# Altium project Anten_Tracker_Karti.PrjPcb
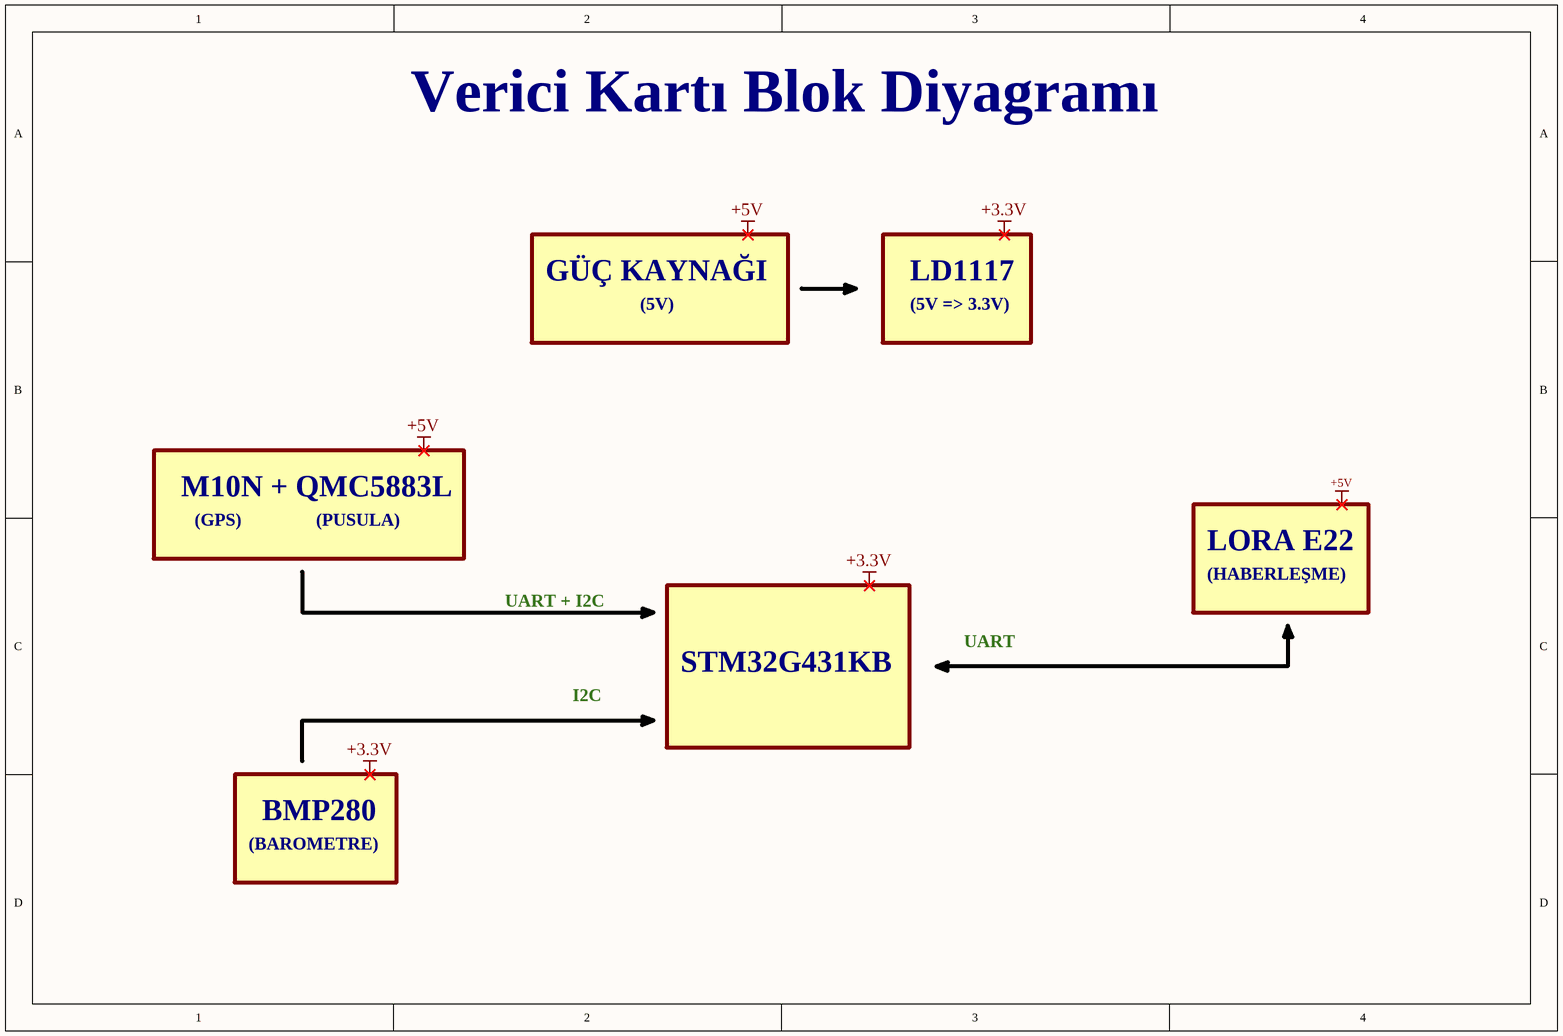
[diagram p0: Verici_Karti_Blok_Diyagram.SchDoc]
6 sheets, 105 parts. Net scope: global (net labels, ports and power ports of the same name join across sheets).
Board file: Anten-Tracker-PCB.PcbDoc
Sheets:
  Verici_Karti_Blok_Diyagram.SchDoc
  Alici_Karti_Blok_Diyagram.SchDoc
  Alici_Karti_Blok_Diyagram_V2.SchDoc
  STM32.SchDoc
  Harici_Birimler.SchDoc
  Dahili_Birimler.SchDoc

## Sheet Verici_Karti_Blok_Diyagram.SchDoc
size A4; SheetNumber: 1; SheetTotal: 6

### Notes on the sheet
- Verici Kartı Blok Diyagramı
- GÜÇ KAYNAĞI
- (5V)
- LD1117
- (5V => 3.3V)
- M10N + QMC5883L
- (GPS)
- (PUSULA)
- LORA E22
- (HABERLEŞME)
- UART + I2C
- UART
- I2C
- STM32G431KB
- (BAROMETRE)
- BMP280
- Labels drawn without touching a wire or pin: +3.3V, +5V

## Sheet Alici_Karti_Blok_Diyagram.SchDoc
size A4; SheetNumber: 2; SheetTotal: 6
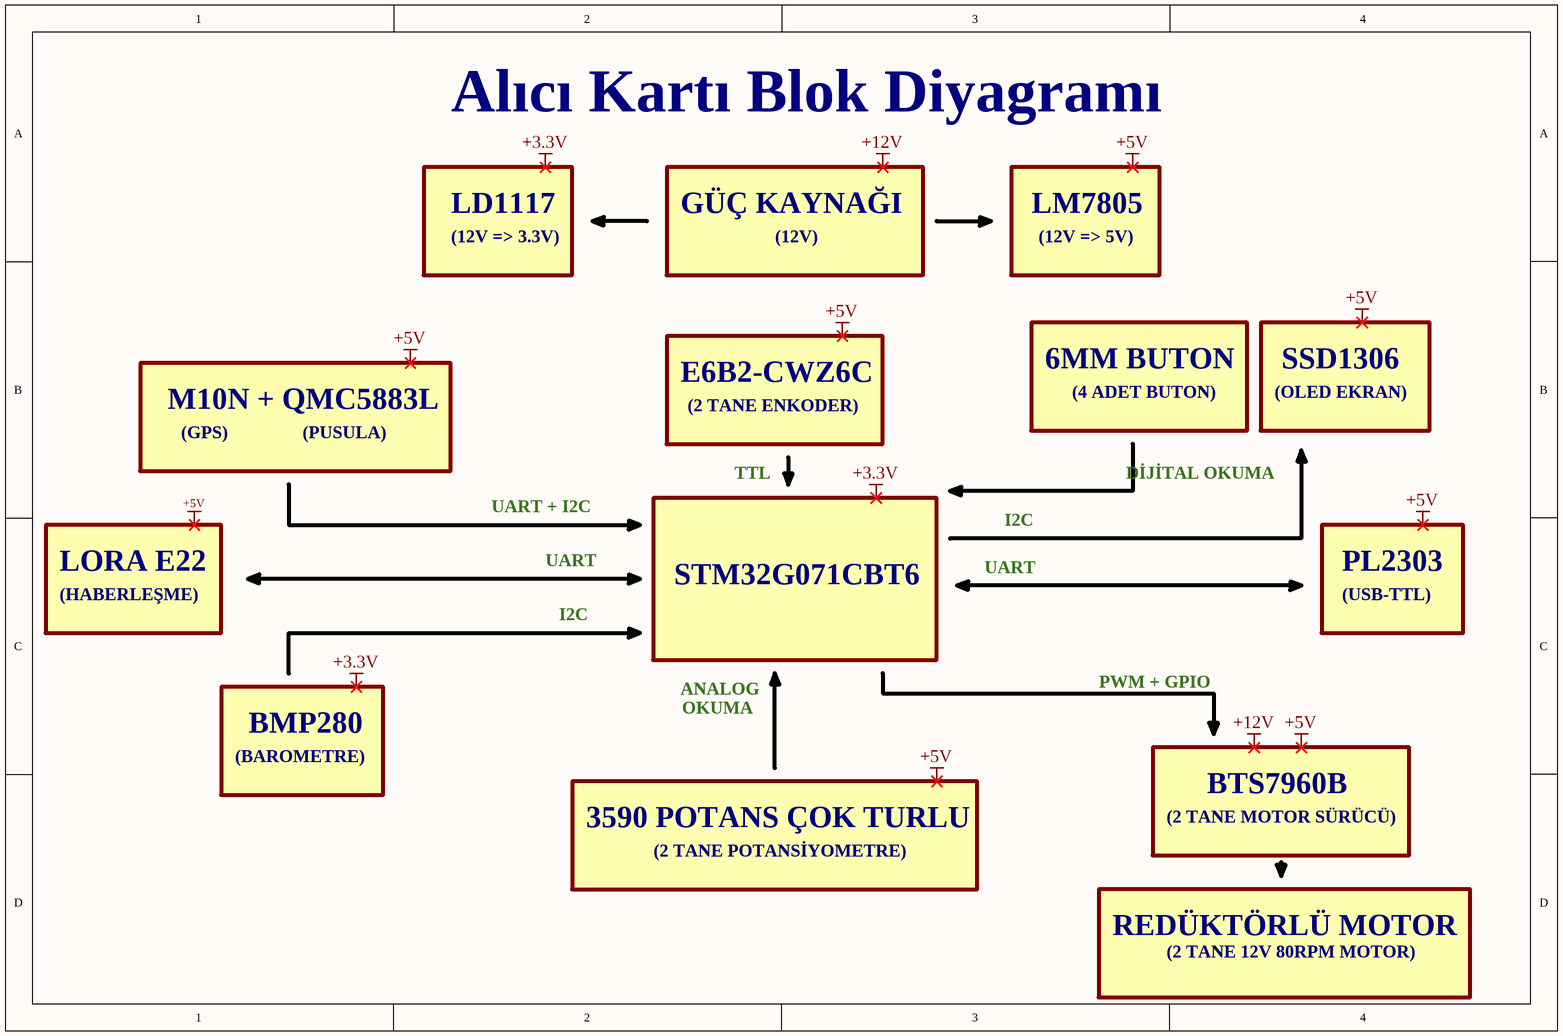
[diagram p1: Alici_Karti_Blok_Diyagram.SchDoc]

### Notes on the sheet
- Alıcı Kartı Blok Diyagramı
- LD1117
- (12V => 3.3V)
- GÜÇ KAYNAĞI
- (12V)
- LM7805
- (12V => 5V)
- E6B2-CWZ6C
- 6MM BUTON
- SSD1306
- M10N + QMC5883L
- (GPS)
- (PUSULA)
- (2 TANE ENKODER)
- (4 ADET BUTON)
- (OLED EKRAN)
- UART + I2C
- TTL
- DİJİTAL OKUMA
- LORA E22
- UART
- I2C
- PL2303
- (HABERLEŞME)
- STM32G071CBT6
- (USB-TTL)
- ANALOG
- OKUMA
- PWM + GPIO
- (BAROMETRE)
- BMP280
- 3590 POTANS ÇOK TURLU
- (2 TANE MOTOR SÜRÜCÜ)
- BTS7960B
- (2 TANE POTANSİYOMETRE)
- REDÜKTÖRLÜ MOTOR
- (2 TANE 12V 80RPM MOTOR)
- Labels drawn without touching a wire or pin: +3.3V, +5V, +12V

## Sheet Alici_Karti_Blok_Diyagram_V2.SchDoc
size A4; SheetNumber: 3; SheetTotal: 6
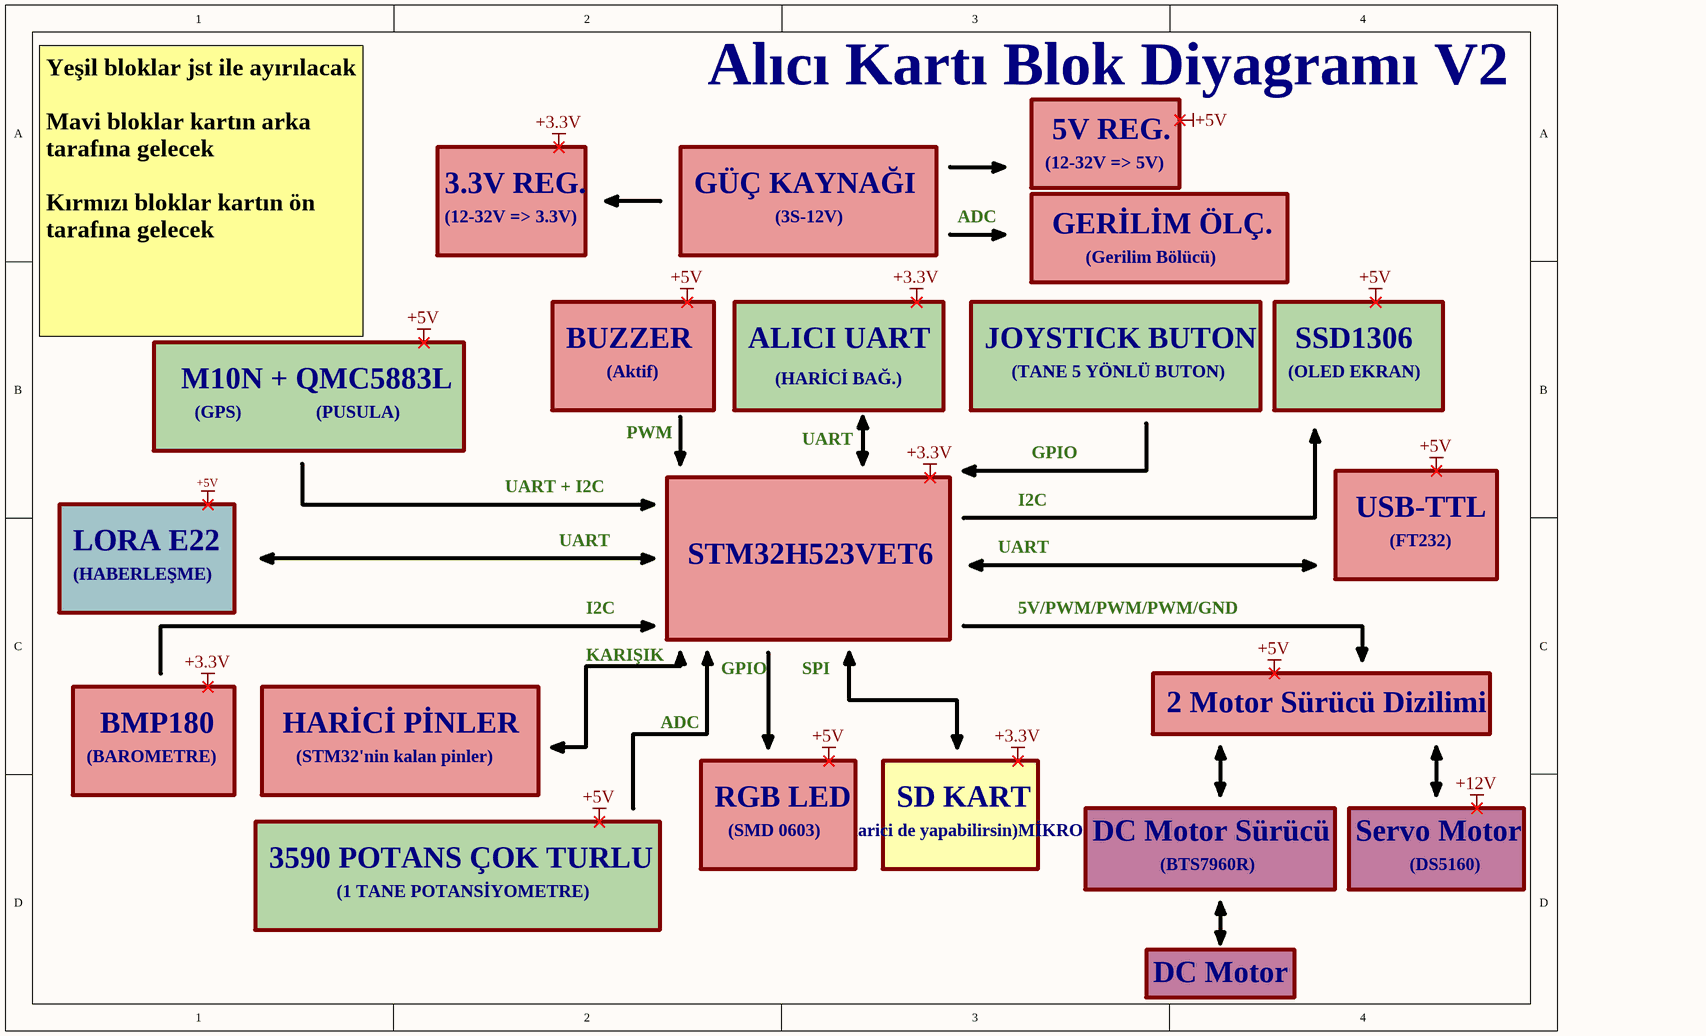
[diagram p2: Alici_Karti_Blok_Diyagram_V2.SchDoc]

### Notes on the sheet
- Alıcı Kartı Blok Diyagramı V2
- (12-32V => 5V)
- 5V REG.
- 3.3V REG.
- (12-32V => 3.3V)
- GÜÇ KAYNAĞI
- (3S-12V)
- ADC
- GERİLİM ÖLÇ.
- (Gerilim Bölücü)
- Yeşil bloklar jst ile ayırılacak
  Mavi bloklar kartın arka tarafına gelecek
  Kırmızı bloklar kartın ön tarafına gelecek
- BUZZER
- (Aktif)
- ALICI UART
- (HARİCİ BAĞ.)
- JOYSTICK BUTON
- (TANE 5 YÖNLÜ BUTON)
- (OLED EKRAN)
- SSD1306
- M10N + QMC5883L
- (GPS)
- (PUSULA)
- PWM
- UART
- UART + I2C
- I2C
- GPIO
- USB-TTL
- LORA E22
- (HABERLEŞME)
- STM32H523VET6
- (FT232)
- 5V/PWM/PWM/PWM/GND
- KARIŞIK
- SPI
- 2 Motor Sürücü Dizilimi
- (BAROMETRE)
- BMP180
- HARİCİ PİNLER
- (STM32'nin kalan pinler)
- RGB LED
- (SMD 0603)
- ((harici de yapabilirsin)MİKRO SD)
- SD KART
- DC Motor Sürücü
- Servo Motor
- 3590 POTANS ÇOK TURLU
- (1 TANE POTANSİYOMETRE)
- (BTS7960R)
- (DS5160)
- DC Motor
- Labels drawn without touching a wire or pin: +3.3V, +5V, +12V

## Sheet STM32.SchDoc
size A4; SheetNumber: 4; SheetTotal: 6
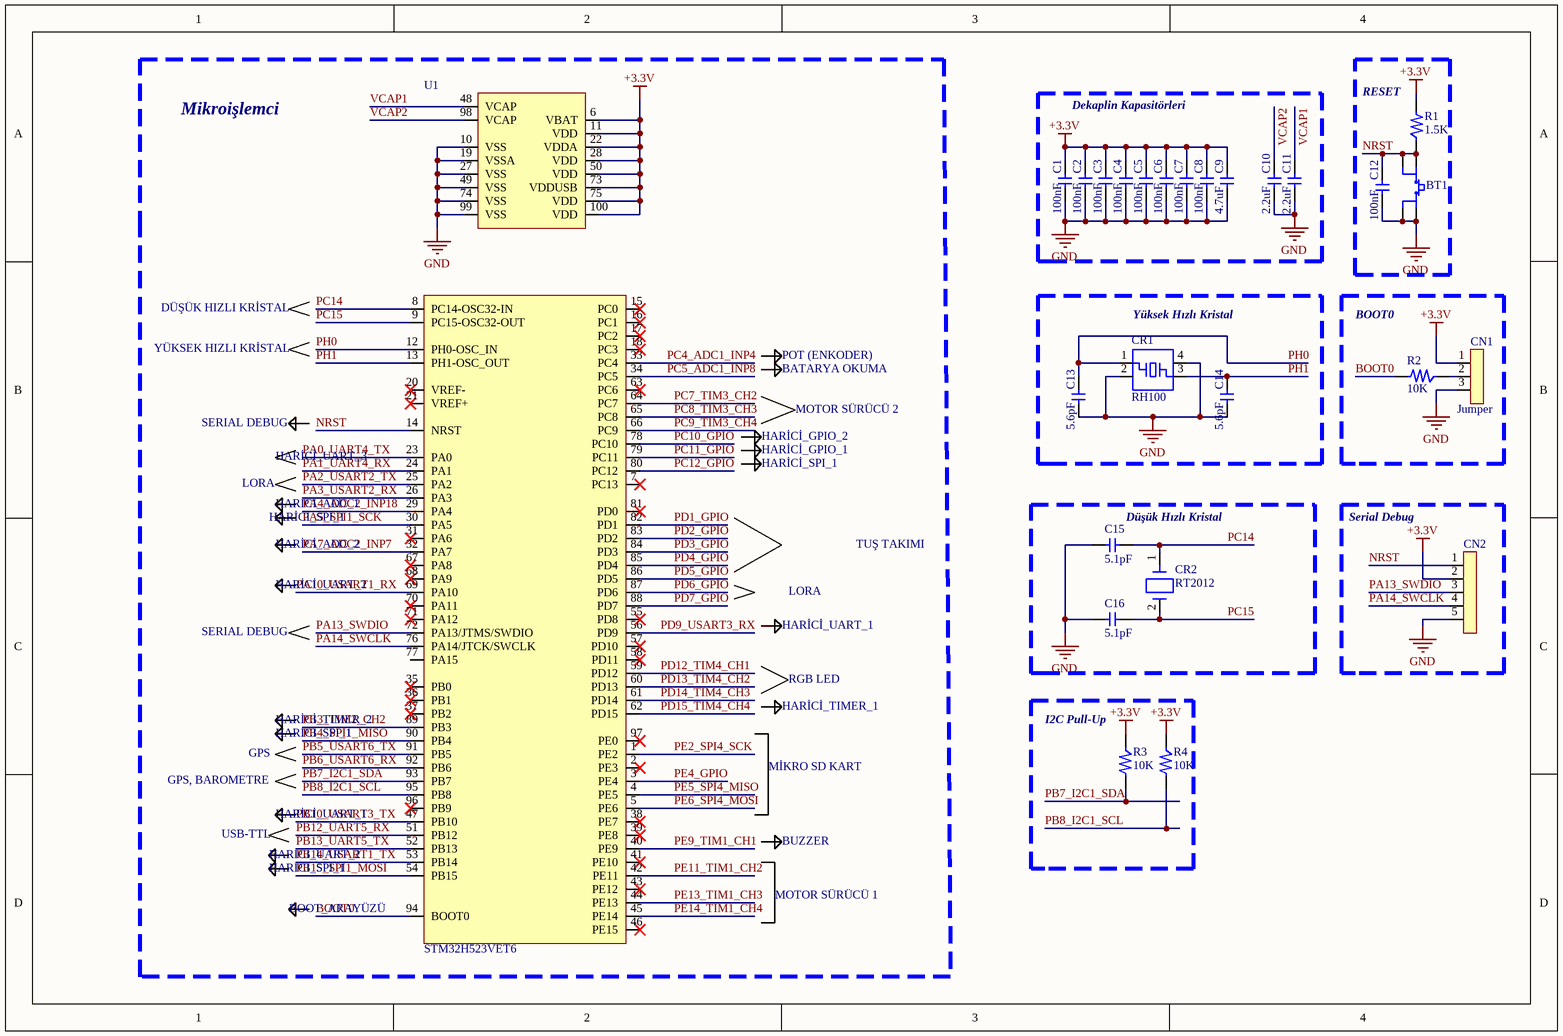
[diagram p3: STM32.SchDoc]

### Parts
BT1  5_mm_Buton  [5mm_buton]  (value not drawn)
C1  value 100nF  [CAP_0603]  (hidden comment: CAP_0603)
C2  value 100nF  [CAP_0603]  (hidden comment: CAP_0603)
C3  value 100nF  [CAP_0603]  (hidden comment: CAP_0603)
C4  value 100nF  [CAP_0603]  (hidden comment: CAP_0603)
C5  value 100nF  [CAP_0603]  (hidden comment: CAP_0603)
C6  value 100nF  [CAP_0603]  (hidden comment: CAP_0603)
C7  value 100nF  [CAP_0603]  (hidden comment: CAP_0603)
C8  value 100nF  [CAP_0603]  (hidden comment: CAP_0603)
C9  value 4.7uF  [CAP_0603]  (hidden comment: CAP_0603)
C10  value 2.2uF  [CAP_0603]  (hidden comment: CAP_0603)
C11  value 2.2uF  [CAP_0603]  (hidden comment: CAP_0603)
C12  value 100nF  [CAP_0603]  (hidden comment: CAP_0603)
C13  value 5.6pF  [CAP_0603]  (hidden comment: CAP_0603)
C14  value 5.6pF  [CAP_0603]  (hidden comment: CAP_0603)
C15  value 5.1pF  [CAP_0603]  (hidden comment: CAP_0603)
C16  value 5.1pF  [CAP_0603]  (hidden comment: CAP_0603)
CN1  Jumper  [3_PIN_HEADER]
CN2  5_Pin_Header  [5_PIN_HEADER]  (value not drawn)
CR1  RH100  [RH100]
CR2  RT2012  [RT2012]
R1  value 1.5K  [RES_0603]  (hidden comment: RES_0603)
R2  value 10K  [RES_0603]  (hidden comment: RES_0603)
R3  value 10K  [RES_0603]  (hidden comment: RES_0603)
R4  value 10K  [RES_0603]  (hidden comment: RES_0603)
U1  STM32H523VET6  [LQFP100]

### Blocks framed on the sheet
Mikroişlemci: U1

### Nets
+3.3V: C1.2 C2.2 C3.2 C4.2 C5.2 C6.2 C7.2 C8.2 C9.2 CN1.1 CN2.2 R1.1 R3.2 R4.2 U1.6(VBAT) U1.11(VDD) U1.22(VDDA) U1.28(VDD) U1.50(VDD) U1.73(VDDUSB) U1.75(VDD) U1.100(VDD)
GND: BT1.2 BT1.3 C1.1 C2.1 C3.1 C4.1 C5.1 C6.1 C7.1 C8.1 C9.1 C10.1 C11.1 C12.1 C13.1 C14.1 C15.2 C16.2 CN1.3 CN2.5 CR1.2 CR1.4 U1.10(VSS) U1.19(VSSA) U1.27(VSS) U1.49(VSS) U1.74(VSS) U1.99(VSS)
BOOT0: R2.1 U1.94(BOOT0)
NRST: BT1.1 BT1.4 C12.2 CN2.1 R1.2 U1.14(NRST)
PA0_UART4_TX: U1.23(PA0)
PA1_UART4_RX: U1.24(PA1)
PA2_USART2_TX: U1.25(PA2)
PA3_USART2_RX: U1.26(PA3)
PA4_ADC2_INP18: U1.29(PA4)
PA5_SPI1_SCK: U1.30(PA5)
PA7_ADC2_INP7: U1.32(PA7)
PA10_USART1_RX: U1.69(PA10)
PA13_SWDIO: CN2.3 U1.72(PA13/JTMS/SWDIO)
PA14_SWCLK: CN2.4 U1.76(PA14/JTCK/SWCLK)
PB3_TIM2_CH2: U1.89(PB3)
PB4_SPI1_MISO: U1.90(PB4)
PB5_USART6_TX: U1.91(PB5)
PB6_USART6_RX: U1.92(PB6)
PB7_I2C1_SDA: R3.1 U1.93(PB7)
PB8_I2C1_SCL: R4.1 U1.95(PB8)
PB10_USART3_TX: U1.47(PB10)
PB12_UART5_RX: U1.51(PB12)
PB13_UART5_TX: U1.52(PB13)
PB14_USART1_TX: U1.53(PB14)
PB15_SPI1_MOSI: U1.54(PB15)
PC4_ADC1_INP4: U1.33(PC4)
PC5_ADC1_INP8: U1.34(PC5)
PC7_TIM3_CH2: U1.64(PC7)
PC8_TIM3_CH3: U1.65(PC8)
PC9_TIM3_CH4: U1.66(PC9)
PC10_GPIO: U1.78(PC10)
PC11_GPIO: U1.79(PC11)
PC12_GPIO: U1.80(PC12)
PC14: C15.1 CR2.1 U1.8(PC14-OSC32-IN)
PC15: C16.1 CR2.2 U1.9(PC15-OSC32-OUT)
PD1_GPIO: U1.82(PD1)
PD2_GPIO: U1.83(PD2)
PD3_GPIO: U1.84(PD3)
PD4_GPIO: U1.85(PD4)
PD5_GPIO: U1.86(PD5)
PD6_GPIO: U1.87(PD6)
PD7_GPIO: U1.88(PD7)
PD9_USART3_RX: U1.56(PD9)
PD12_TIM4_CH1: U1.59(PD12)
PD13_TIM4_CH2: U1.60(PD13)
PD14_TIM4_CH3: U1.61(PD14)
PD15_TIM4_CH4: U1.62(PD15)
PE2_SPI4_SCK: U1.1(PE2)
PE4_GPIO: U1.3(PE4)
PE5_SPI4_MISO: U1.4(PE5)
PE6_SPI4_MOSI: U1.5(PE6)
PE9_TIM1_CH1: U1.40(PE9)
PE11_TIM1_CH2: U1.42(PE11)
PE13_TIM1_CH3: U1.44(PE13)
PE14_TIM1_CH4: U1.45(PE14)
PH0: C13.2 CR1.1 U1.12(PH0-OSC_IN)
PH1: C14.2 CR1.3 U1.13(PH1-OSC_OUT)
VCAP1: C11.2 U1.48(VCAP)
VCAP2: C10.2 U1.98(VCAP)
NetCN1_2: CN1.2 R2.2

Not connected (* = marked no-connect by the designer): U1 2(PE3)* 7(PC13)* 15(PC0)* 16(PC1)* 17(PC2)* 18(PC3)* 20(VREF-)* 21(VREF+)* 31(PA6)* 35(PB0)* 36(PB1)* 37(PB2)* 38(PE7)* 39(PE8)* 41(PE10)* 43(PE12)* 46(PE15)* 55(PD8)* 57(PD10)* 58(PD11)* 63(PC6)* 67(PA8)* 68(PA9)* 70(PA11)* 71(PA12)* 77(PA15) 81(PD0)* 96(PB9)* 97(PE0)*

### Notes on the sheet
- Dekaplin Kapasitörleri
- (near R1) RESET
- DÜŞÜK HIZLI KRİSTAL
- YÜKSEK HIZLI KRİSTAL
- BATARYA OKUMA
- POT (ENKODER)
- (near CR1) Yüksek Hızlı Kristal
- BOOT0
- SERIAL DEBUG
- HARİCİ_GPIO_2
- MOTOR SÜRÜCÜ 2
- LORA
- HARİCİ_SPI_1
- HARİCİ_ADC_1
- HARİCİ_UART_3
- HARİCİ_GPIO_1
- (near C15) Düşük Hızlı Kristal
- Serial Debug
- HARİCİ_ADC_2
- TUŞ TAKIMI
- HARİCİ_UART_2
- HARİCİ_UART_1
- HARİCİ_TIMER_1
- RGB LED
- GPS, BAROMETRE
- GPS
- HARİCİ_TIMER_2
- MİKRO SD KART
- (near R3) I2C Pull-Up
- USB-TTL
- BUZZER
- BOOT_ARAYÜZÜ
- MOTOR SÜRÜCÜ 1

### Library data of the parts
CN1 = 3_Pin_2.54mm
CN2 = 5_Pin_2.54mm
CR1 = 16_MHz_Crystal
CR2 = RT2012_Kristal

## Sheet Harici_Birimler.SchDoc
size A4; SheetNumber: 5; SheetTotal: 6
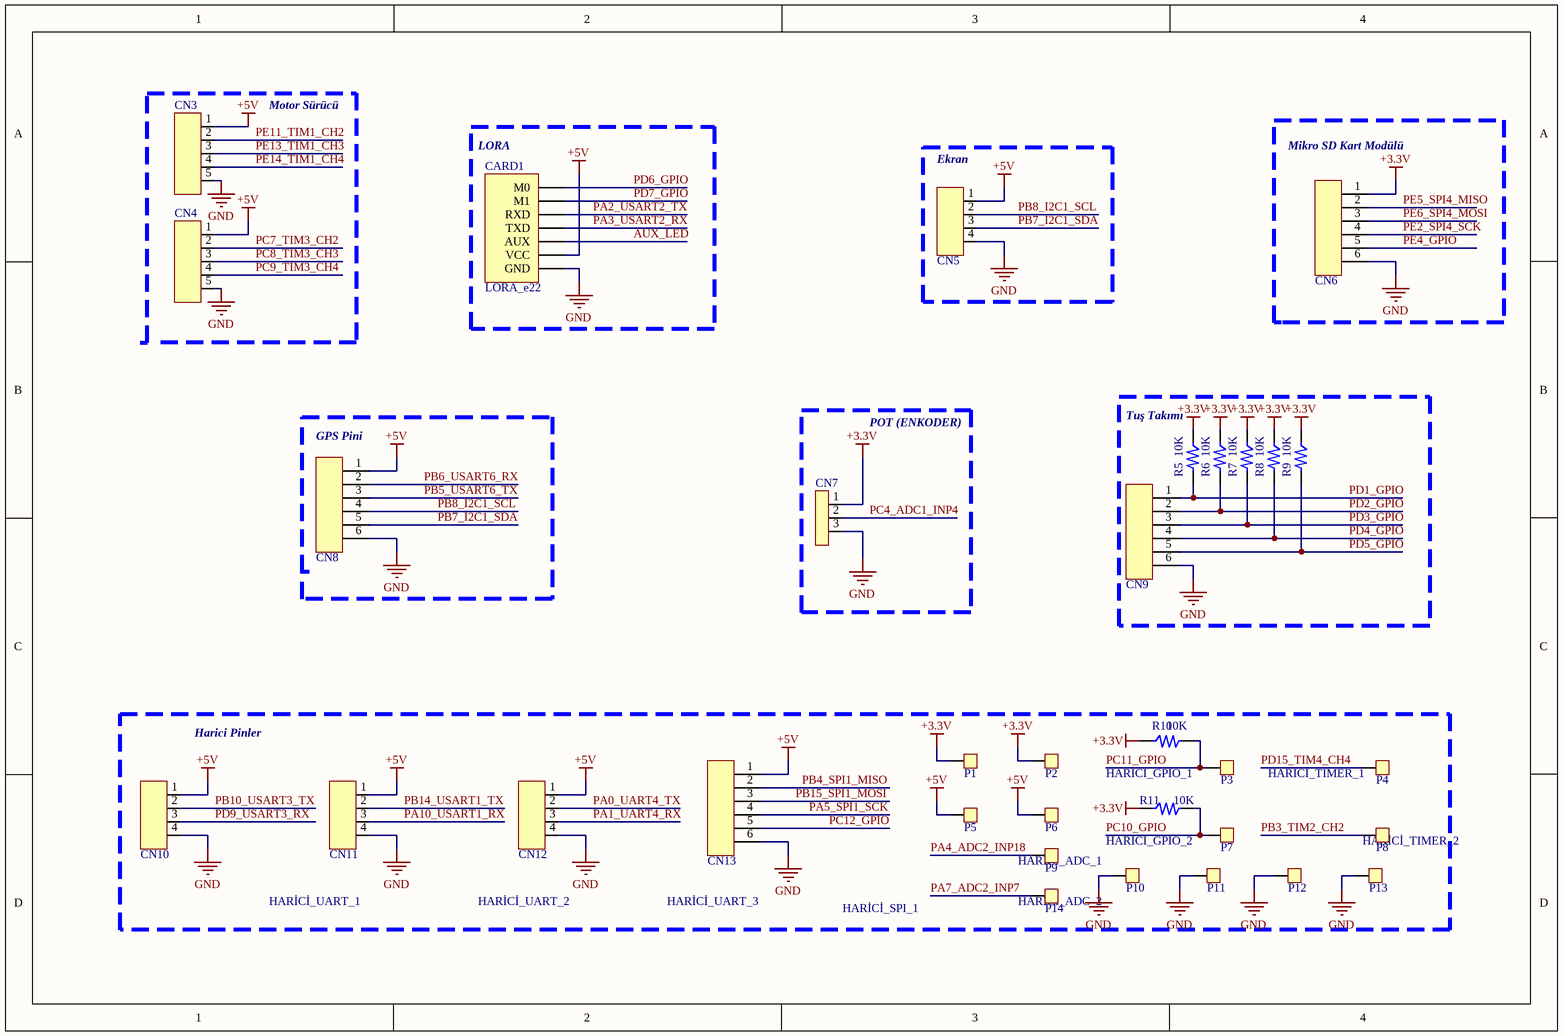
[diagram p4: Harici_Birimler.SchDoc]

### Parts
CARD1  LORA_e22  [LORA e22]
CN3  jst_conn_5_pin  [64800611622_CONN_5_PIN]  (value not drawn)
CN4  jst_conn_5_pin  [64800611622_CONN_5_PIN]  (value not drawn)
CN5  jst_conn_4_pin  [64800611622 _conn_4_pin]  (value not drawn)
CN6  jst_conn_6_pin  [64800611622_conn_6_pin]  (value not drawn)
CN7  3_Pin_Header  [3_PIN_HEADER]  (value not drawn)
CN8  jst_conn_6_pin  [64800611622_conn_6_pin]  (value not drawn)
CN9  jst_conn_6_pin  [64800611622_conn_6_pin]  (value not drawn)
CN10  jst_conn_4_pin  [64800611622 _conn_4_pin]  (value not drawn)
CN11  jst_conn_4_pin  [64800611622 _conn_4_pin]  (value not drawn)
CN12  jst_conn_4_pin  [64800611622 _conn_4_pin]  (value not drawn)
CN13  jst_conn_6_pin  [64800611622_conn_6_pin]  (value not drawn)
P1  ped  [ped]  (value not drawn)
P2  ped  [ped]  (value not drawn)
P3  ped  [ped]  (value not drawn)
P4  ped  [ped]  (value not drawn)
P5  ped  [ped]  (value not drawn)
P6  ped  [ped]  (value not drawn)
P7  ped  [ped]  (value not drawn)
P8  ped  [ped]  (value not drawn)
P9  ped  [ped]  (value not drawn)
P10  ped  [ped]  (value not drawn)
P11  ped  [ped]  (value not drawn)
P12  ped  [ped]  (value not drawn)
P13  ped  [ped]  (value not drawn)
P14  ped  [ped]  (value not drawn)
R5  value 10K  [RES_0603]  (hidden comment: RES_0603)
R6  value 10K  [RES_0603]  (hidden comment: RES_0603)
R7  value 10K  [RES_0603]  (hidden comment: RES_0603)
R8  value 10K  [RES_0603]  (hidden comment: RES_0603)
R9  value 10K  [RES_0603]  (hidden comment: RES_0603)
R10  value 10K  [RES_0603]  (hidden comment: RES_0603)
R11  value 10K  [RES_0603]  (hidden comment: RES_0603)

### Blocks framed on the sheet
Tuş Takımı: CN9 R5-R9

### Nets
+3.3V: CN6.1 CN7.1 P1.1 P2.1 R5.2 R6.2 R7.2 R8.2 R9.2 R10.2 R11.2
+5V: CARD1.6(VCC) CN3.1 CN4.1 CN5.1 CN8.1 CN10.1 CN11.1 CN12.1 CN13.1 P5.1 P6.1
GND: CARD1.7(GND) CN3.5 CN4.5 CN5.4 CN6.6 CN7.3 CN8.6 CN9.6 CN10.4 CN11.4 CN12.4 CN13.6 P10.1 P11.1 P12.1 P13.1
AUX_LED: CARD1.5(AUX)
PA0_UART4_TX: CN12.2
PA1_UART4_RX: CN12.3
PA2_USART2_TX: CARD1.3(RXD)
PA3_USART2_RX: CARD1.4(TXD)
PA4_ADC2_INP18: P9.1
PA5_SPI1_SCK: CN13.4
PA7_ADC2_INP7: P14.1
PA10_USART1_RX: CN11.3
PB3_TIM2_CH2: P8.1
PB4_SPI1_MISO: CN13.2
PB5_USART6_TX: CN8.3
PB6_USART6_RX: CN8.2
PB7_I2C1_SDA: CN5.3 CN8.5
PB8_I2C1_SCL: CN5.2 CN8.4
PB10_USART3_TX: CN10.2
PB14_USART1_TX: CN11.2
PB15_SPI1_MOSI: CN13.3
PC4_ADC1_INP4: CN7.2
PC7_TIM3_CH2: CN4.2
PC8_TIM3_CH3: CN4.3
PC9_TIM3_CH4: CN4.4
PC10_GPIO: P7.1 R11.1
PC11_GPIO: P3.1 R10.1
PC12_GPIO: CN13.5
PD1_GPIO: CN9.1 R5.1
PD2_GPIO: CN9.2 R6.1
PD3_GPIO: CN9.3 R7.1
PD4_GPIO: CN9.4 R8.1
PD5_GPIO: CN9.5 R9.1
PD6_GPIO: CARD1.1(M0)
PD7_GPIO: CARD1.2(M1)
PD9_USART3_RX: CN10.3
PD15_TIM4_CH4: P4.1
PE2_SPI4_SCK: CN6.4
PE4_GPIO: CN6.5
PE5_SPI4_MISO: CN6.2
PE6_SPI4_MOSI: CN6.3
PE11_TIM1_CH2: CN3.2
PE13_TIM1_CH3: CN3.3
PE14_TIM1_CH4: CN3.4

### Notes on the sheet
- Motor Sürücü
- (near CARD1) LORA
- (near CN5) Ekran
- (near CN6) Mikro SD Kart Modülü
- (near CN8) GPS Pini
- POT (ENKODER)
- Harici Pinler
- HARİCİ_GPIO_1
- (near P4) HARİCİ_TIMER_1
- HARİCİ_GPIO_2
- (near P8) HARİCİ_TIMER_2
- HARİCİ_UART_1
- HARİCİ_UART_2
- HARİCİ_UART_3
- HARİCİ_SPI_1
- HARİCİ_ADC_1
- (near P14) HARİCİ_ADC_2

### Library data of the parts
CN3 CN4 = 64800611622_conn_5_pin
CN5 CN10-CN12 = 64800611622 _conn_4_pin
CN6 CN8 CN9 CN13 = 64800611622 _conn_6_pin
CN7 = 3_Pin_2.54mm

## Sheet Dahili_Birimler.SchDoc
size A4; SheetNumber: 6; SheetTotal: 6
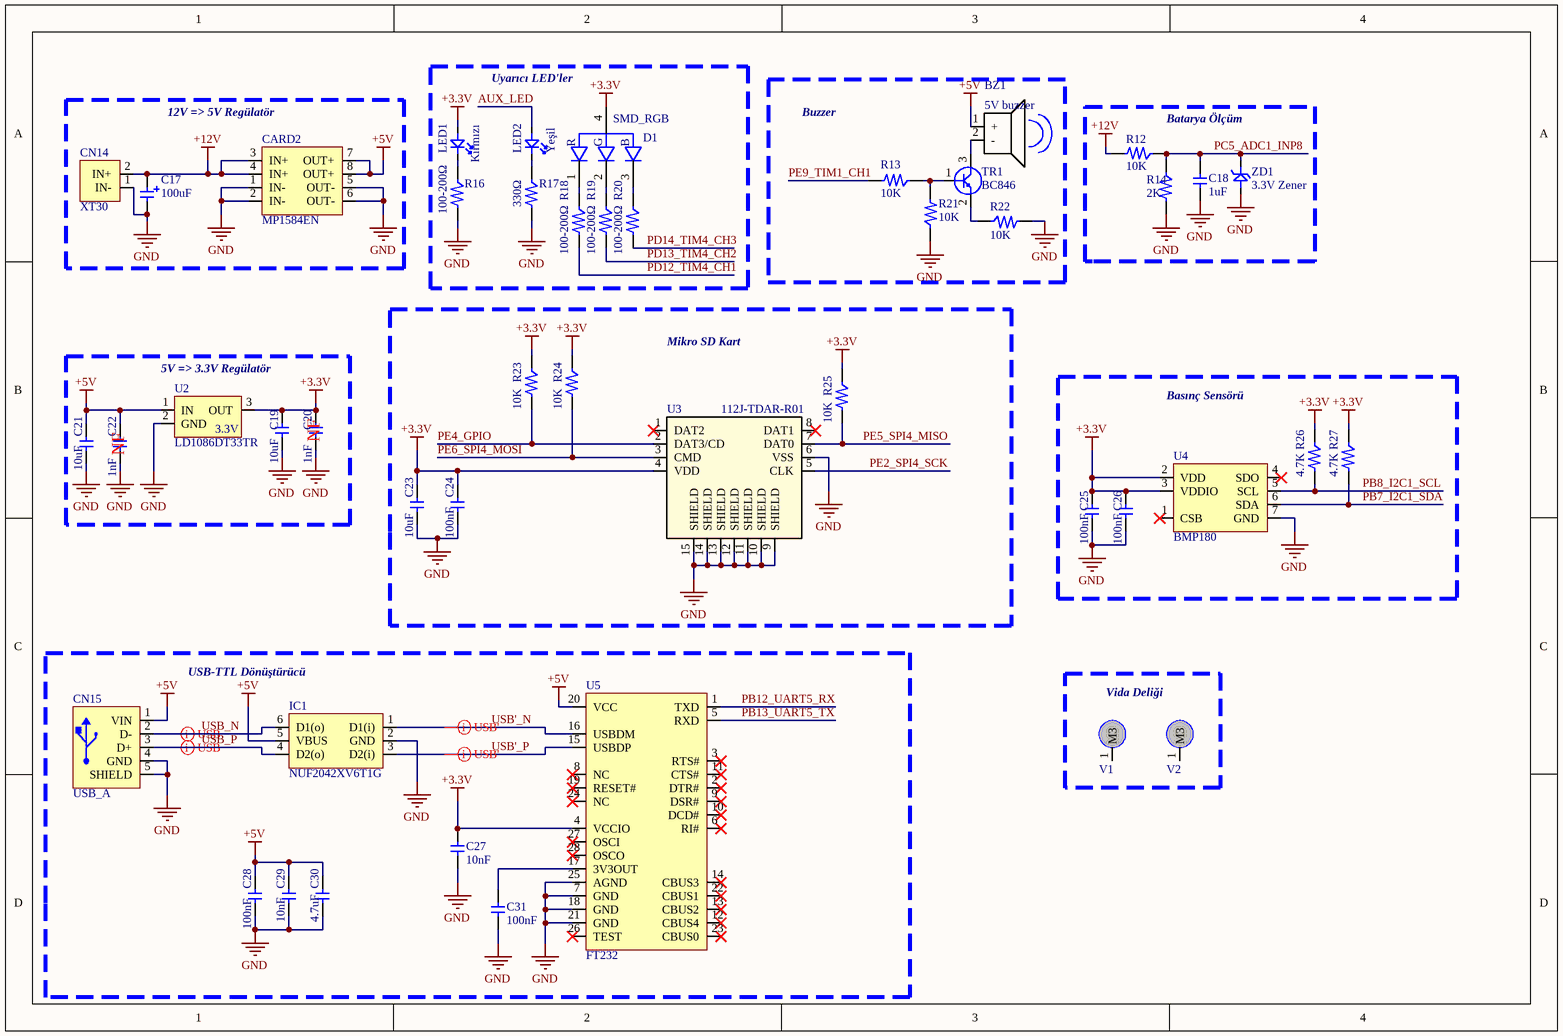
[diagram p5: Dahili_Birimler.SchDoc]

### Parts
BZ1  5V buzzer  [5v buzer]
C17  value 100uF  [CAP_Elec]  (hidden comment: CAP_Elec)
C18  value 1uF  [CAP_0603]  (hidden comment: CAP_0603)
C19  value 10uF  [CAP_0603]  (hidden comment: CAP_0603)
C20  value 1nF  [CAP_0603]  (hidden comment: CAP_0603)
C21  value 10uF  [CAP_0603]  (hidden comment: CAP_0603)
C22  value 1nF  [CAP_0603]  (hidden comment: CAP_0603)
C23  value 10uF  [CAP_0603]  (hidden comment: CAP_0603)
C24  value 100nF  [CAP_0603]  (hidden comment: CAP_0603)
C25  value 100nF  [CAP_0603]  (hidden comment: CAP_0603)
C26  value 100nF  [CAP_0603]  (hidden comment: CAP_0603)
C27  value 10nF  [CAP_0603]  (hidden comment: CAP_0603)
C28  value 100nF  [CAP_0603]  (hidden comment: CAP_0603)
C29  value 10nF  [CAP_0603]  (hidden comment: CAP_0603)
C30  value 4.7uF  [CAP_0603]  (hidden comment: CAP_0603)
C31  value 100nF  [CAP_0603]  (hidden comment: CAP_0603)
CARD2  MP1584EN  [MP1584]
CN14  XT30  [XT30]
CN15  USB_A  [USB_A]
D1  SMD_RGB  [LED_LTST-C19HE1WT]
IC1  NUF2042XV6T1G  [SOT-563-6]
LED1  Kırmızı  [1206_LED]
LED2  Yeşil  [1206_LED]
R12  value 10K  [RES_0603]  (hidden comment: RES_0603)
R13  value 10K  [RES_0603]  (hidden comment: RES_0603)
R14  value 2K  [RES_0603]  (hidden comment: RES_0603)
R16  value 100-200Ω  [RES_0603]  (hidden comment: RES_0603)
R17  value 330Ω  [RES_0603]  (hidden comment: RES_0603)
R18  value 100-200Ω  [RES_0603]  (hidden comment: RES_0603)
R19  value 100-200Ω  [RES_0603]  (hidden comment: RES_0603)
R20  value 100-200Ω  [RES_0603]  (hidden comment: RES_0603)
R21  value 10K  [RES_0603]  (hidden comment: RES_0603)
R22  value 10K  [RES_0603]  (hidden comment: RES_0603)
R23  value 10K  [RES_0603]  (hidden comment: RES_0603)
R24  value 10K  [RES_0603]  (hidden comment: RES_0603)
R25  value 10K  [RES_0603]  (hidden comment: RES_0603)
R26  value 4.7K  [RES_0603]  (hidden comment: RES_0603)
R27  value 4.7K  [RES_0603]  (hidden comment: RES_0603)
TR1  BC846  [SOT-23]
U2  LD1086DT33TR  [DPAK]
U3  112J-TDAR-R01  [112J-TDAR-R01_ATT]
U4  BMP180  [BMP180]
U5  FT232  [SSOP-28]
V1  Vida Deliği 3mm  [m3_vide_deliği]  (value not drawn)
V2  Vida Deliği 3mm  [m3_vide_deliği]  (value not drawn)
ZD1  3.3V Zener  [SOD-123]

### Blocks framed on the sheet
Buzzer: BZ1 R13 R21 R22 TR1
12V => 5V Regülatör: C17 CARD2 CN14
Mikro SD Kart: C23 C24 R23-R25 U3
USB-TTL Dönüştürücü: C27-C31 CN15 IC1 U5
Vida Deliği: V1 V2

### Nets
+3.3V: C19.2 C20.2 C23.2 C24.2 C25.2 C26.2 C27.2 D1.4 LED1.1 R23.2 R24.2 R25.2 R26.2 R27.2 U2.3(OUT) U3.4(VDD) U4.2(VDD) U4.3(VDDIO) U5.4(VCCIO)
+5V: BZ1.1(+) C21.2 C22.2 C28.2 C29.2 C30.2 CARD2.7(OUT+) CARD2.8(OUT+) CN15.1(VIN) IC1.5(VBUS) U2.1(IN) U5.20(VCC)
+12V: C17.1 CARD2.3(IN+) CARD2.4(IN+) CN14.2(IN+) R12.1
GND: C17.2 C18.1 C19.1 C20.1 C21.1 C22.1 C23.1 C24.1 C25.1 C26.1 C27.1 C28.1 C29.1 C30.1 C31.1 CARD2.1(IN-) CARD2.2(IN-) CARD2.5(OUT-) CARD2.6(OUT-) CN14.1(IN-) CN15.4(GND) CN15.5(SHIELD) IC1.2(GND) R14.1 R16.1 R17.1 R21.2 R22.1 U2.2(GND) U3.6(VSS) U3.9(SHIELD) U3.10(SHIELD) U3.11(SHIELD) U3.12(SHIELD) U3.13(SHIELD) U3.14(SHIELD) U3.15(SHIELD) U4.7(GND) U5.7(GND) U5.18(GND) U5.21(GND) U5.25(AGND) ZD1.1
AUX_LED: LED2.1
PB7_I2C1_SDA: R27.1 U4.6(SDA)
PB8_I2C1_SCL: R26.1 U4.5(SCL)
PB12_UART5_RX: U5.1(TXD)
PB13_UART5_TX: U5.5(RXD)
PC5_ADC1_INP8: C18.2 R12.2 R14.2 ZD1.2
PD12_TIM4_CH1: R18.1
PD13_TIM4_CH2: R19.1
PD14_TIM4_CH3: R20.1
PE2_SPI4_SCK: U3.5(CLK)
PE4_GPIO: R23.1 U3.2(DAT3/CD)
PE5_SPI4_MISO: R25.1 U3.7(DAT0)
PE6_SPI4_MOSI: R24.1 U3.3(CMD)
PE9_TIM1_CH1: R13.1
USB'_N: IC1.1(D1(i)) U5.16(USBDM)
USB'_P: IC1.3(D2(i)) U5.15(USBDP)
USB_N: CN15.2(D-) IC1.6(D1(o))
USB_P: CN15.3(D+) IC1.4(D2(o))
NetBZ1_2: BZ1.2(-) TR1.3(G)
NetC31_2: C31.2 U5.17(3V3OUT)
NetD1_1: D1.1 R18.2
NetD1_2: D1.2 R19.2
NetD1_3: D1.3 R20.2
NetLED1_2: LED1.2 R16.2
NetLED2_2: LED2.2 R17.2
NetR13_2: R13.2 R21.1 TR1.1(G)
NetR22_2: R22.2 TR1.2(G)

Not connected (* = marked no-connect by the designer): U3 1(DAT2)* 8(DAT1)*; U4 1(CSB)* 4(SDO)*; U5 2(DTR#)* 3(RTS#)* 6(RI#)* 8(NC)* 9(DSR#)* 10(DCD#)* 11(CTS#)* 12(CBUS4)* 13(CBUS2)* 14(CBUS3)* 19(RESET#)* 22(CBUS1)* 23(CBUS0)* 24(NC)* 26(TEST)* 27(OSCI)* 28(OSCO)*; V1 1(M3); V2 1(M3)

### Layout directives
differential pair; net class USB: USB_N, USB_P
differential pair; net class USB': USB'_N, USB'_P

### Notes on the sheet
- Uyarıcı LED'ler
- Batarya Ölçüm
- 5V => 3.3V Regülatör
- (near C22) NF
- (near C20) NF
- Basınç Sensörü
- (in symbol LD1086DT33TR) 3.3V
- (in symbol LTST-C19HE1WT) R; G; B

### Library data of the parts
BZ1 = Buzzer
CARD2 = MP1584EN_kartı
D1 = LTST-C19HE1WT: Red, Green, Blue (RGB) 624nm Red, 525nm Green, 470nm Blue LED Indication - Discrete 2.1V Red, 3.35V Green, 3.35V Blue 0606 (1616 Metric); MF: Lite-On Inc.; SnapEDA_Link: https://www.snapeda.com/parts/LTST-C19HE1WT/Lite-On/view-part/?ref=snap; Package: 0606 Lite-On; Value: *; MP: LTST-C19HE1WT; Check_prices: https://www.snapeda.com/parts/LTST-C19HE1WT/Lite-On/view-part/?ref=eda
LED1 LED2 = 1206_LED
U3 = 112J-TDAR-R01: Description; Manufacturer_Name: Attend; Copyright: Copyright (C) 2025 Ultra Librarian. All rights reserved.; Manufacturer_Part_Number: 112J-TDAR-R01; RefDes: RefDes; Type: Type
ZD1 = SMD_Zener_Diyot

## Nets that join several sheets
+3.3V: STM32 (22 pins), Harici_Birimler (11 pins), Dahili_Birimler (19 pins)
+5V: Harici_Birimler (11 pins), Dahili_Birimler (12 pins)
GND: STM32 (28 pins), Harici_Birimler (16 pins), Dahili_Birimler (43 pins)
AUX_LED: Harici_Birimler (CARD1.5), Dahili_Birimler (LED2.1)
PA0_UART4_TX: STM32 (U1.23), Harici_Birimler (CN12.2)
PA1_UART4_RX: STM32 (U1.24), Harici_Birimler (CN12.3)
PA2_USART2_TX: STM32 (U1.25), Harici_Birimler (CARD1.3)
PA3_USART2_RX: STM32 (U1.26), Harici_Birimler (CARD1.4)
PA4_ADC2_INP18: STM32 (U1.29), Harici_Birimler (P9.1)
PA5_SPI1_SCK: STM32 (U1.30), Harici_Birimler (CN13.4)
PA7_ADC2_INP7: STM32 (U1.32), Harici_Birimler (P14.1)
PA10_USART1_RX: STM32 (U1.69), Harici_Birimler (CN11.3)
PB3_TIM2_CH2: STM32 (U1.89), Harici_Birimler (P8.1)
PB4_SPI1_MISO: STM32 (U1.90), Harici_Birimler (CN13.2)
PB5_USART6_TX: STM32 (U1.91), Harici_Birimler (CN8.3)
PB6_USART6_RX: STM32 (U1.92), Harici_Birimler (CN8.2)
PB7_I2C1_SDA: STM32 (R3.1 U1.93), Harici_Birimler (CN5.3 CN8.5), Dahili_Birimler (R27.1 U4.6)
PB8_I2C1_SCL: STM32 (R4.1 U1.95), Harici_Birimler (CN5.2 CN8.4), Dahili_Birimler (R26.1 U4.5)
PB10_USART3_TX: STM32 (U1.47), Harici_Birimler (CN10.2)
PB12_UART5_RX: STM32 (U1.51), Dahili_Birimler (U5.1)
PB13_UART5_TX: STM32 (U1.52), Dahili_Birimler (U5.5)
PB14_USART1_TX: STM32 (U1.53), Harici_Birimler (CN11.2)
PB15_SPI1_MOSI: STM32 (U1.54), Harici_Birimler (CN13.3)
PC4_ADC1_INP4: STM32 (U1.33), Harici_Birimler (CN7.2)
PC5_ADC1_INP8: STM32 (U1.34), Dahili_Birimler (C18.2 R12.2 R14.2 ZD1.2)
PC7_TIM3_CH2: STM32 (U1.64), Harici_Birimler (CN4.2)
PC8_TIM3_CH3: STM32 (U1.65), Harici_Birimler (CN4.3)
PC9_TIM3_CH4: STM32 (U1.66), Harici_Birimler (CN4.4)
PC10_GPIO: STM32 (U1.78), Harici_Birimler (P7.1 R11.1)
PC11_GPIO: STM32 (U1.79), Harici_Birimler (P3.1 R10.1)
PC12_GPIO: STM32 (U1.80), Harici_Birimler (CN13.5)
PD1_GPIO: STM32 (U1.82), Harici_Birimler (CN9.1 R5.1)
PD2_GPIO: STM32 (U1.83), Harici_Birimler (CN9.2 R6.1)
PD3_GPIO: STM32 (U1.84), Harici_Birimler (CN9.3 R7.1)
PD4_GPIO: STM32 (U1.85), Harici_Birimler (CN9.4 R8.1)
PD5_GPIO: STM32 (U1.86), Harici_Birimler (CN9.5 R9.1)
PD6_GPIO: STM32 (U1.87), Harici_Birimler (CARD1.1)
PD7_GPIO: STM32 (U1.88), Harici_Birimler (CARD1.2)
PD9_USART3_RX: STM32 (U1.56), Harici_Birimler (CN10.3)
PD12_TIM4_CH1: STM32 (U1.59), Dahili_Birimler (R18.1)
PD13_TIM4_CH2: STM32 (U1.60), Dahili_Birimler (R19.1)
PD14_TIM4_CH3: STM32 (U1.61), Dahili_Birimler (R20.1)
PD15_TIM4_CH4: STM32 (U1.62), Harici_Birimler (P4.1)
PE2_SPI4_SCK: STM32 (U1.1), Harici_Birimler (CN6.4), Dahili_Birimler (U3.5)
PE4_GPIO: STM32 (U1.3), Harici_Birimler (CN6.5), Dahili_Birimler (R23.1 U3.2)
PE5_SPI4_MISO: STM32 (U1.4), Harici_Birimler (CN6.2), Dahili_Birimler (R25.1 U3.7)
PE6_SPI4_MOSI: STM32 (U1.5), Harici_Birimler (CN6.3), Dahili_Birimler (R24.1 U3.3)
PE9_TIM1_CH1: STM32 (U1.40), Dahili_Birimler (R13.1)
PE11_TIM1_CH2: STM32 (U1.42), Harici_Birimler (CN3.2)
PE13_TIM1_CH3: STM32 (U1.44), Harici_Birimler (CN3.3)
PE14_TIM1_CH4: STM32 (U1.45), Harici_Birimler (CN3.4)